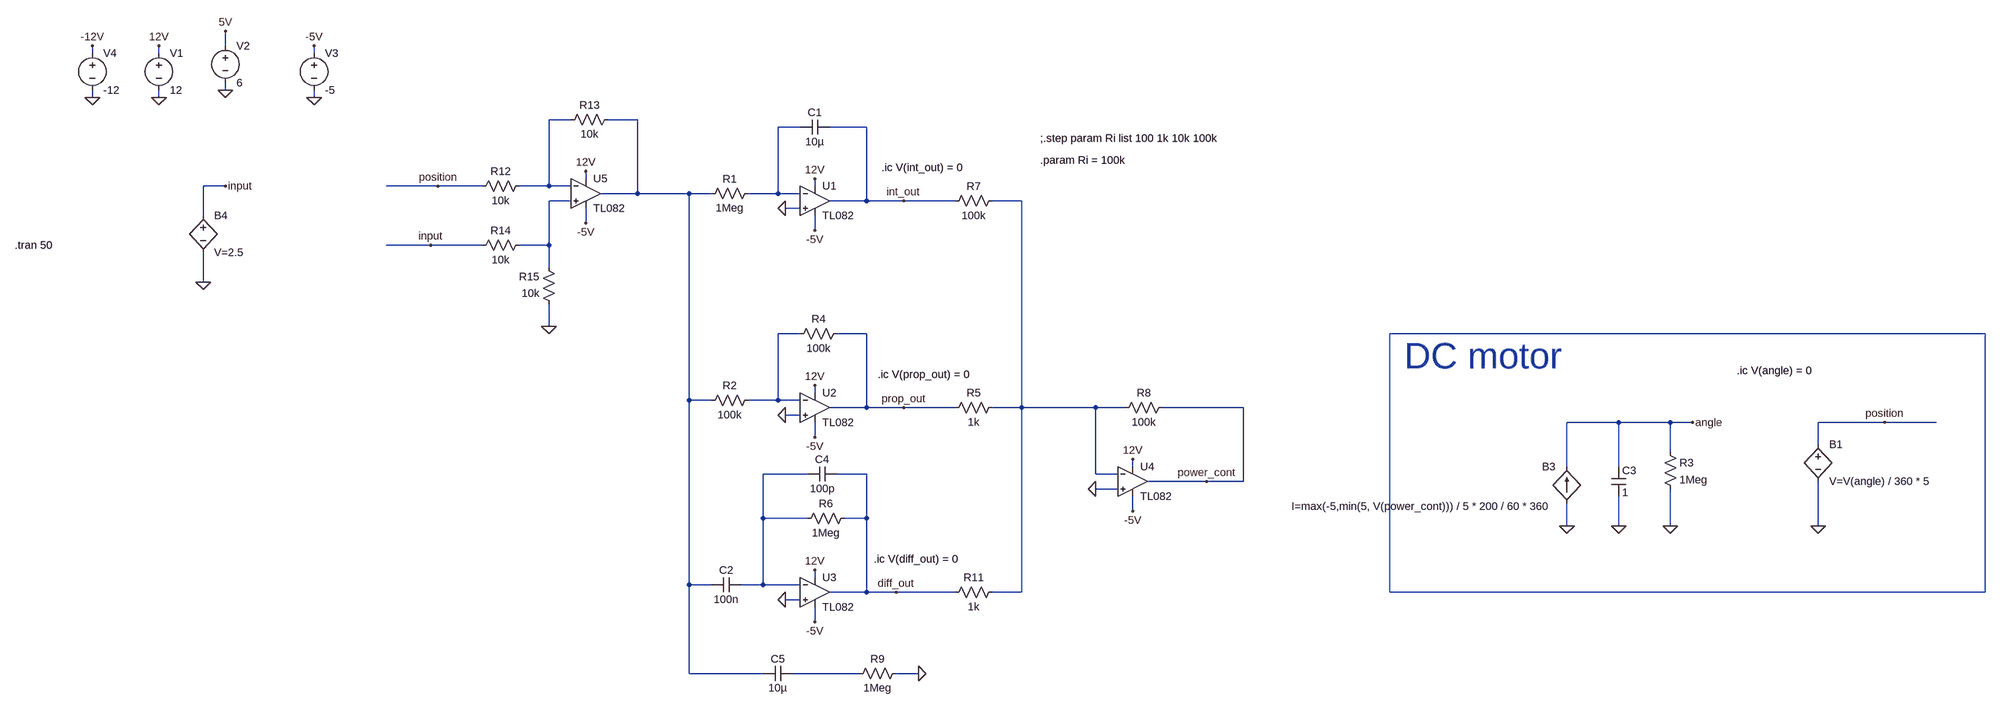
[diagram p0: schematic PID_v2.asc]
PID_v2.asc, the LTspice schematic file:
Version 4
SHEET 1 4308 1280
WIRE -416 -128 -416 -160
WIRE -704 -112 -704 -128
WIRE -560 -112 -560 -128
WIRE -224 -112 -224 -128
WIRE -416 -32 -416 -48
WIRE -704 -16 -704 -32
WIRE -560 -16 -560 -32
WIRE -224 -16 -224 -32
WIRE 944 32 896 32
WIRE 1088 32 1024 32
WIRE 1440 48 1392 48
WIRE 1584 48 1504 48
WIRE 976 160 976 144
WIRE -416 176 -464 176
WIRE 656 176 544 176
WIRE 752 176 656 176
WIRE 896 176 896 32
WIRE 896 176 832 176
WIRE 944 176 896 176
WIRE 1472 176 1472 160
WIRE 1088 192 1088 32
WIRE 1088 192 1008 192
WIRE 1200 192 1088 192
WIRE 1248 192 1200 192
WIRE 1392 192 1392 48
WIRE 1392 192 1328 192
WIRE 1440 192 1392 192
WIRE 944 208 896 208
WIRE 1584 208 1584 48
WIRE 1584 208 1504 208
WIRE 1664 208 1584 208
WIRE 1776 208 1664 208
WIRE 1920 208 1856 208
WIRE 1440 224 1408 224
WIRE -464 240 -464 176
WIRE 976 256 976 224
WIRE 1472 272 1472 240
WIRE 640 304 544 304
WIRE 752 304 640 304
WIRE 896 304 896 208
WIRE 896 304 832 304
WIRE 896 352 896 304
WIRE -464 384 -464 320
WIRE 896 480 896 432
WIRE 1440 496 1392 496
WIRE 1584 496 1520 496
WIRE 4304 496 2816 496
WIRE 1472 624 1472 608
WIRE 1200 640 1200 192
WIRE 1248 640 1200 640
WIRE 1392 640 1392 496
WIRE 1392 640 1328 640
WIRE 1440 640 1392 640
WIRE 1584 656 1584 496
WIRE 1584 656 1504 656
WIRE 1664 656 1584 656
WIRE 1776 656 1664 656
WIRE 1920 656 1920 208
WIRE 1920 656 1856 656
WIRE 2080 656 1920 656
WIRE 2144 656 2080 656
WIRE 2400 656 2224 656
WIRE 1440 672 1408 672
WIRE 3312 688 3200 688
WIRE 3424 688 3312 688
WIRE 3472 688 3424 688
WIRE 3888 688 3744 688
WIRE 4000 688 3888 688
WIRE 1472 720 1472 688
WIRE 3744 736 3744 688
WIRE 3424 752 3424 688
WIRE 2160 784 2160 768
WIRE 3200 784 3200 688
WIRE 3312 784 3312 688
WIRE 1456 800 1360 800
WIRE 1584 800 1520 800
WIRE 2080 800 2080 656
WIRE 2128 800 2080 800
WIRE 2320 816 2192 816
WIRE 2400 816 2400 656
WIRE 2400 816 2320 816
WIRE 2128 832 2080 832
WIRE 2160 880 2160 848
WIRE 1360 896 1360 800
WIRE 1456 896 1360 896
WIRE 1584 896 1584 800
WIRE 1584 896 1536 896
WIRE 3200 912 3200 864
WIRE 3312 912 3312 848
WIRE 3424 912 3424 832
WIRE 3744 912 3744 816
WIRE 1472 1024 1472 1008
WIRE 1200 1040 1200 640
WIRE 1248 1040 1200 1040
WIRE 1360 1040 1360 896
WIRE 1360 1040 1312 1040
WIRE 1440 1040 1360 1040
WIRE 1584 1056 1584 896
WIRE 1584 1056 1504 1056
WIRE 1648 1056 1584 1056
WIRE 1776 1056 1648 1056
WIRE 1920 1056 1920 656
WIRE 1920 1056 1856 1056
WIRE 2816 1056 2816 496
WIRE 4304 1056 4304 496
WIRE 4304 1056 2816 1056
WIRE 1440 1072 1408 1072
WIRE 1472 1120 1472 1088
WIRE 1200 1232 1200 1040
WIRE 1360 1232 1200 1232
WIRE 1568 1232 1424 1232
WIRE 1696 1232 1648 1232
FLAG 1472 160 12V
FLAG -416 -160 5V
FLAG -560 -16 0
FLAG -560 -128 12V
FLAG -416 -32 0
FLAG -464 384 0
FLAG -416 176 input
FLAG 1472 608 12V
FLAG 2160 768 12V
FLAG 2320 816 power_cont
FLAG -704 -16 0
FLAG -704 -128 -12V
FLAG 3312 912 0
FLAG 3200 912 0
FLAG 3888 688 position
FLAG 1408 224 0
FLAG 1408 672 0
FLAG 2080 832 0
FLAG 1472 1008 12V
FLAG 1408 1072 0
FLAG -224 -16 0
FLAG -224 -128 -5V
FLAG 1472 272 -5V
FLAG 1472 720 -5V
FLAG 2160 880 -5V
FLAG 1472 1120 -5V
FLAG 976 144 12V
FLAG 976 256 -5V
FLAG 896 480 0
FLAG 656 176 position
FLAG 640 304 input
FLAG 1664 208 int_out
FLAG 1664 656 prop_out
FLAG 3472 688 angle
FLAG 3744 912 0
FLAG 3424 912 0
FLAG 1648 1056 diff_out
FLAG 1696 1232 0
SYMBOL ZZZ\\OpAmp\\TL082 1472 208 R0
SYMATTR InstName U1
SYMBOL cap 1504 32 R90
WINDOW 0 0 32 VBottom 2
WINDOW 3 32 32 VTop 2
SYMATTR InstName C1
SYMATTR Value 10µ
SYMBOL res 1344 176 R90
WINDOW 0 0 56 VBottom 2
WINDOW 3 32 56 VTop 2
SYMATTR InstName R1
SYMATTR Value 1Meg
SYMBOL voltage -560 -128 R0
WINDOW 123 0 0 Left 0
WINDOW 39 0 0 Left 0
SYMATTR InstName V1
SYMATTR Value 12
SYMBOL voltage -416 -144 R0
WINDOW 123 0 0 Left 0
WINDOW 39 0 0 Left 0
SYMATTR InstName V2
SYMATTR Value 6
SYMBOL ZZZ\\OpAmp\\TL082 1472 656 R0
SYMATTR InstName U2
SYMBOL res 1344 624 R90
WINDOW 0 0 56 VBottom 2
WINDOW 3 32 56 VTop 2
SYMATTR InstName R2
SYMATTR Value 100k
SYMBOL res 1536 480 R90
WINDOW 0 0 56 VBottom 2
WINDOW 3 32 56 VTop 2
SYMATTR InstName R4
SYMATTR Value 100k
SYMBOL ZZZ\\OpAmp\\TL082 2160 816 R0
SYMATTR InstName U4
SYMBOL res 1872 640 R90
WINDOW 0 0 56 VBottom 2
WINDOW 3 32 56 VTop 2
SYMATTR InstName R5
SYMATTR Value 1k
SYMBOL res 1872 192 R90
WINDOW 0 0 56 VBottom 2
WINDOW 3 32 56 VTop 2
SYMATTR InstName R7
SYMATTR Value 100k
SYMBOL res 2240 640 R90
WINDOW 0 0 56 VBottom 2
WINDOW 3 32 56 VTop 2
SYMATTR InstName R8
SYMATTR Value 100k
SYMBOL voltage -704 -128 R0
WINDOW 123 0 0 Left 0
WINDOW 39 0 0 Left 0
SYMATTR InstName V4
SYMATTR Value -12
SYMBOL cap 3296 784 R0
SYMATTR InstName C3
SYMATTR Value 1
SYMBOL bi 3200 864 R180
WINDOW 0 24 80 Left 2
WINDOW 3 37 -6 Left 2
SYMATTR InstName B3
SYMATTR Value I=max(-5,min(5, V(power_cont))) / 5 * 200 / 60 * 360
SYMBOL ZZZ\\OpAmp\\TL082 1472 1056 R0
SYMATTR InstName U3
SYMBOL cap 1312 1024 R90
WINDOW 0 0 32 VBottom 2
WINDOW 3 32 32 VTop 2
SYMATTR InstName C2
SYMATTR Value 100n
SYMBOL res 1552 880 R90
WINDOW 0 0 56 VBottom 2
WINDOW 3 32 56 VTop 2
SYMATTR InstName R6
SYMATTR Value 1Meg
SYMBOL res 1872 1040 R90
WINDOW 0 0 56 VBottom 2
WINDOW 3 32 56 VTop 2
SYMATTR InstName R11
SYMATTR Value 1k
SYMBOL bv -464 224 R0
SYMATTR InstName B4
SYMATTR Value V=2.5
SYMBOL voltage -224 -128 R0
WINDOW 123 0 0 Left 0
WINDOW 39 0 0 Left 0
SYMATTR InstName V3
SYMATTR Value -5
SYMBOL ZZZ\\OpAmp\\TL082 976 192 R0
SYMATTR InstName U5
SYMBOL res 1040 16 R90
WINDOW 0 0 56 VBottom 2
WINDOW 3 32 56 VTop 2
SYMATTR InstName R13
SYMATTR Value 10k
SYMBOL res 848 160 R90
WINDOW 0 0 56 VBottom 2
WINDOW 3 32 56 VTop 2
SYMATTR InstName R12
SYMATTR Value 10k
SYMBOL res 848 288 R90
WINDOW 0 0 56 VBottom 2
WINDOW 3 32 56 VTop 2
SYMATTR InstName R14
SYMATTR Value 10k
SYMBOL res 912 448 R180
WINDOW 0 36 76 Left 2
WINDOW 3 36 40 Left 2
SYMATTR InstName R15
SYMATTR Value 10k
SYMBOL cap 1520 784 R90
WINDOW 0 0 32 VBottom 2
WINDOW 3 32 32 VTop 2
SYMATTR InstName C4
SYMATTR Value 100p
SYMBOL bv 3744 720 R0
SYMATTR InstName B1
SYMATTR Value V=V(angle) / 360 * 5
SYMBOL res 3408 736 R0
SYMATTR InstName R3
SYMATTR Value 1Meg
SYMBOL res 1664 1216 R90
WINDOW 0 0 56 VBottom 2
WINDOW 3 32 56 VTop 2
SYMATTR InstName R9
SYMATTR Value 1Meg
SYMBOL cap 1424 1216 R90
WINDOW 0 0 32 VBottom 2
WINDOW 3 32 32 VTop 2
SYMATTR InstName C5
SYMATTR Value 10µ
TEXT -872 304 Left 2 !.tran 50
TEXT 2848 544 Left 6 ;DC motor
TEXT 1960 72 Left 2 !;.step param Ri list 100 1k 10k 100k
TEXT 1960 120 Left 2 !.param Ri = 100k
TEXT 3568 576 Left 2 !.ic V(angle) = 0
TEXT 1600 984 Left 2 !.ic V(diff_out) = 0
TEXT 1608 584 Left 2 !.ic V(prop_out) = 0
TEXT 1616 136 Left 2 !.ic V(int_out) = 0

The netlist it stands for:
* PID_v2.asc
* U1: TL082 (symbol ZZZ\OpAmp\TL082 not available, pins judged from their places): In+=0 In-=N003 V+=12V V-=-5V OUT=int_out
C1 int_out N003 10µ
R1 N003 N002 1Meg
V1 12V 0 12
V2 5V 0 6
* U2: TL082 (symbol ZZZ\OpAmp\TL082 not available, pins judged from their places): In+=0 In-=N006 V+=12V V-=-5V OUT=prop_out
R2 N006 N002 100k
R4 prop_out N006 100k
* U4: TL082 (symbol ZZZ\OpAmp\TL082 not available, pins judged from their places): In+=0 In-=N005 V+=12V V-=-5V OUT=power_cont
R5 N005 prop_out 1k
R7 N005 int_out 100k
R8 power_cont N005 100k
V4 -12V 0 -12
C3 angle 0 1
B3 0 angle I=max(-5,min(5, V(power_cont))) / 5 * 200 / 60 * 360
* U3: TL082 (symbol ZZZ\OpAmp\TL082 not available, pins judged from their places): In+=0 In-=N008 V+=12V V-=-5V OUT=diff_out
C2 N008 N002 100n
R6 diff_out N008 1Meg
R11 N005 diff_out 1k
B4 input 0 V=2.5
V3 -5V 0 -5
* U5: TL082 (symbol ZZZ\OpAmp\TL082 not available, pins judged from their places): In+=N004 In-=N001 V+=12V V-=-5V OUT=N002
R13 N002 N001 10k
R12 N001 position 10k
R14 N004 input 10k
R15 0 N004 10k
C4 diff_out N008 100p
B1 position 0 V=V(angle) / 360 * 5
R3 angle 0 1Meg
R9 0 N009 1Meg
C5 N009 N002 10µ
.tran 50
* DC motor
;.step param Ri list 100 1k 10k 100k
.param Ri = 100k
.ic V(angle) = 0
.ic V(diff_out) = 0
.ic V(prop_out) = 0
.ic V(int_out) = 0
.backanno
.end